# EasyEDA Pro project New Project_2026-05-11_10-13-02.eprj

# Schematic test1_bruk
Board Name: Board1; Create Date: 2026-05-11; Page Name: schematic_1; Project Name: New Project_2026-05-11_10-13-02; Schematic Name: test1_bruk; Update Date: 2026-05-28; Company: EasyEDA.com; Page Size: A4; Version: V1.0
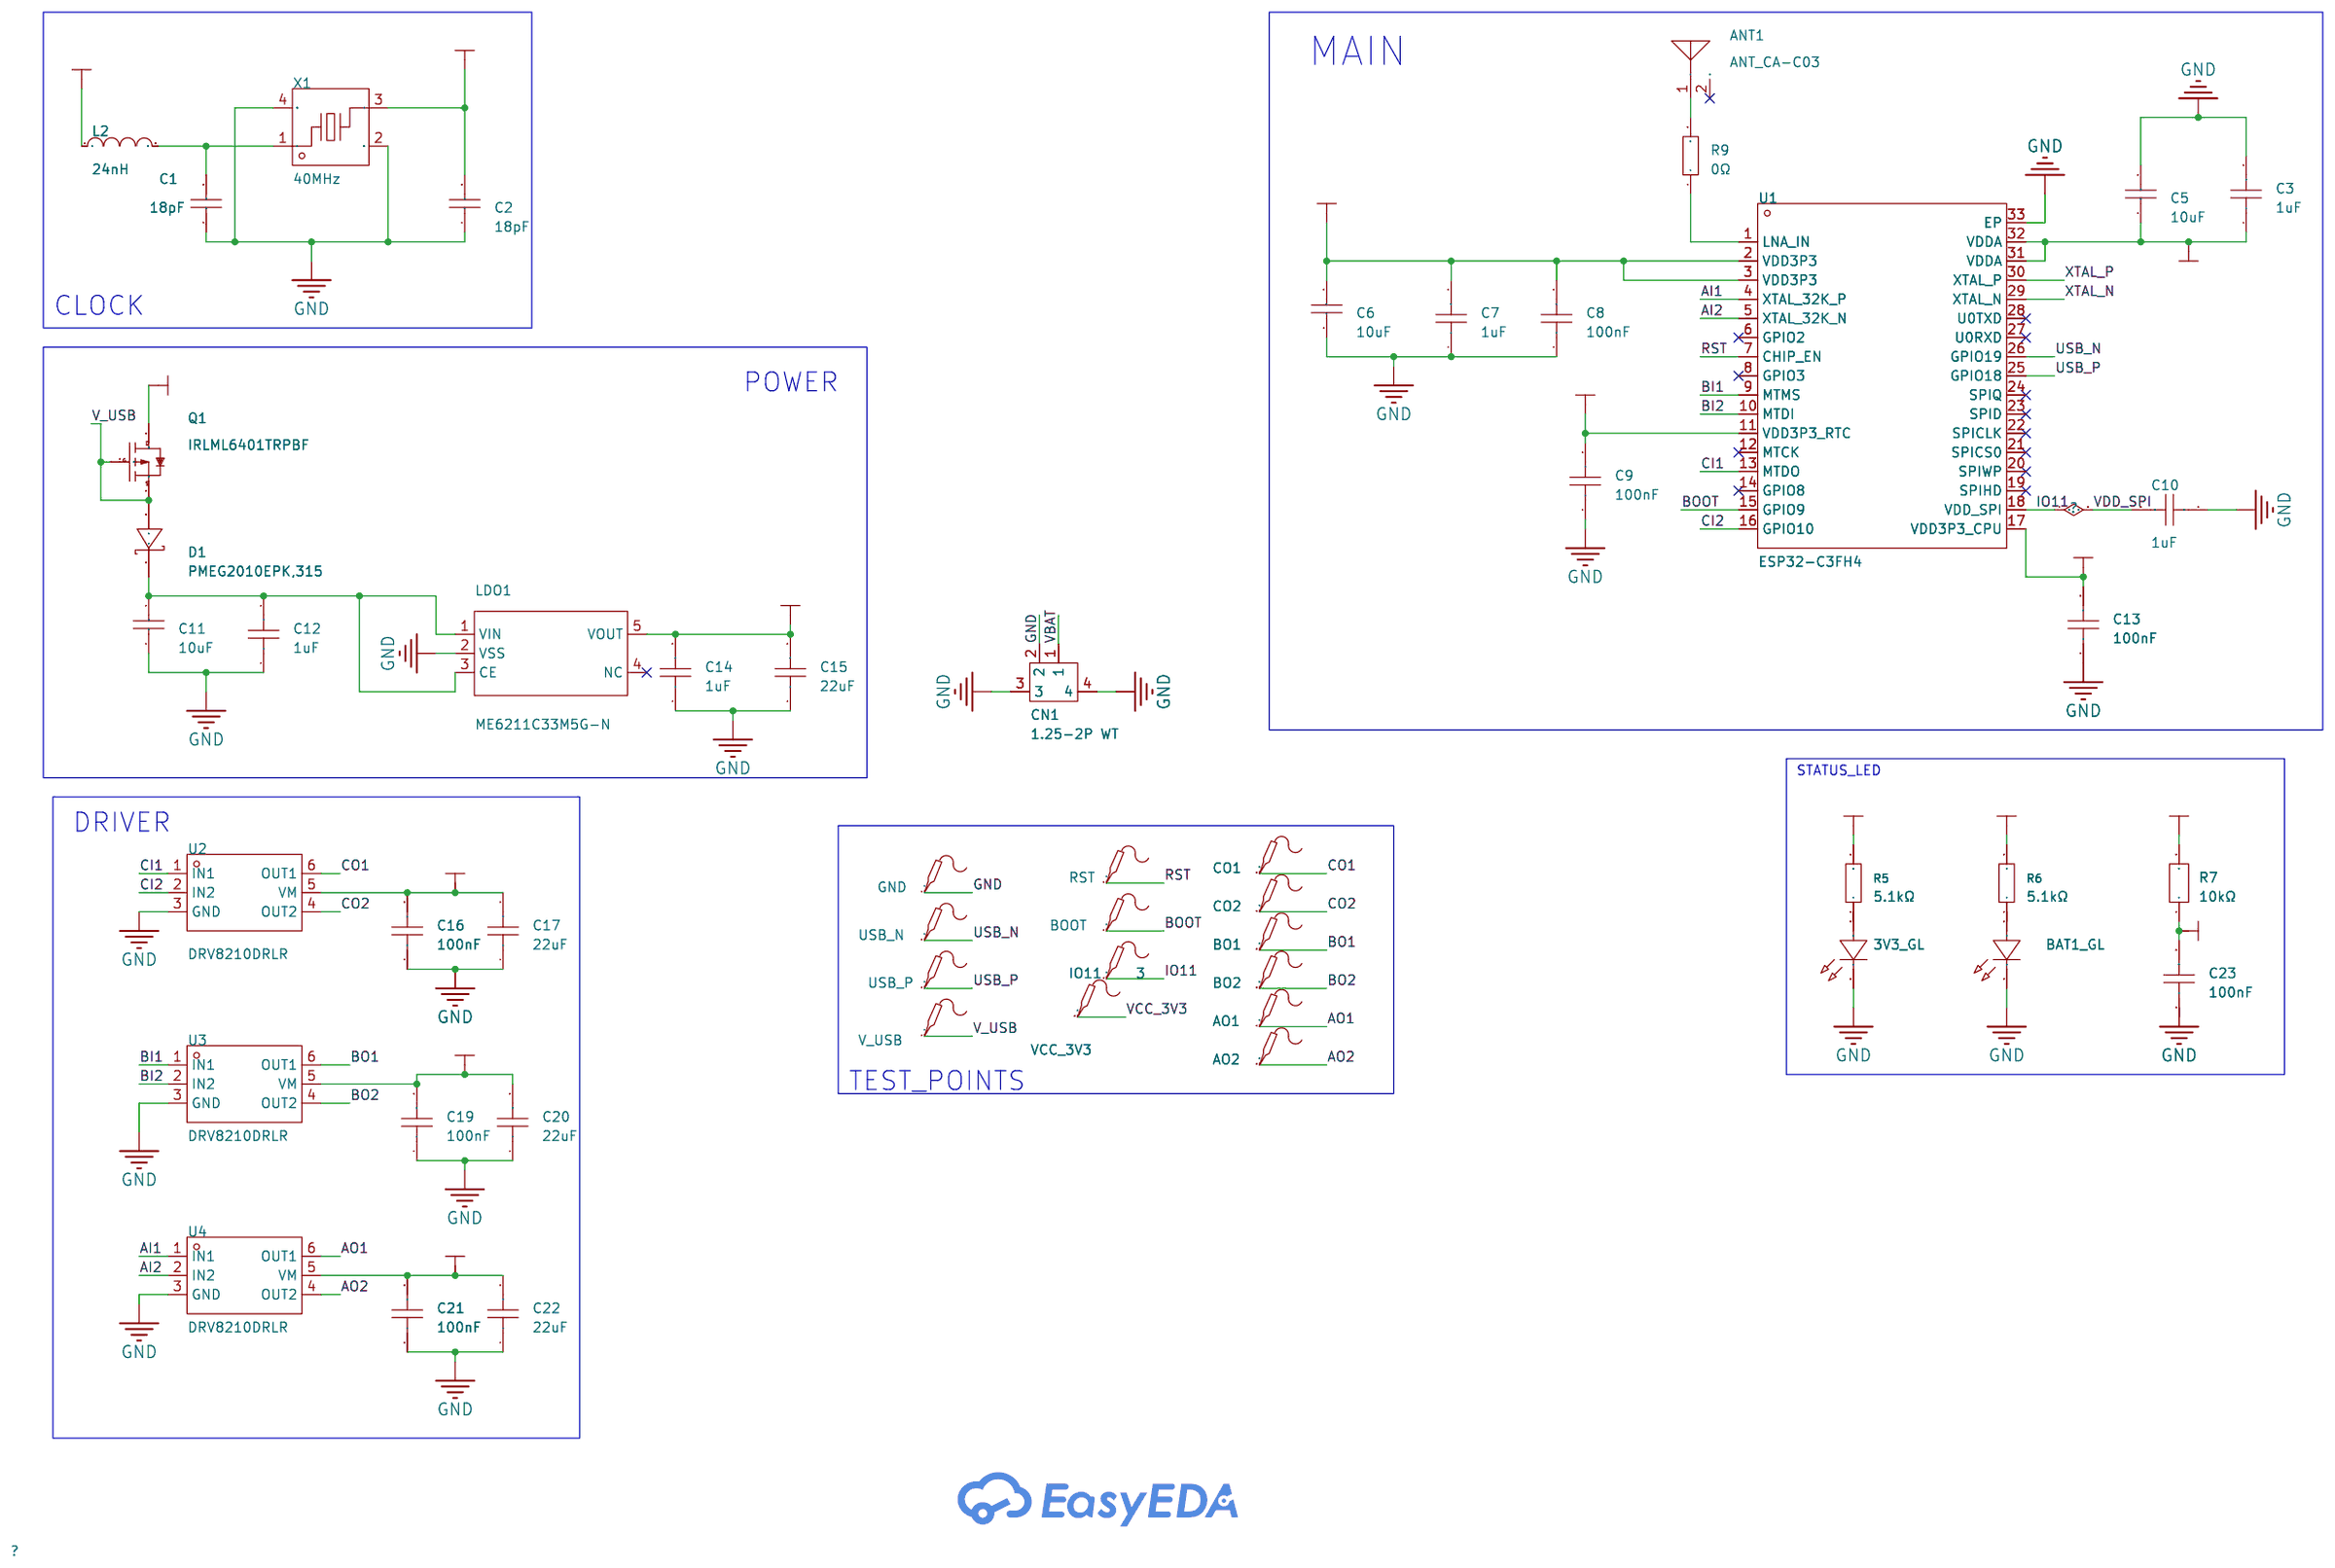
[diagram p0: schematic sheet]

## Parts
3V3_GL  YLED0402G  [LED0402-R-RD]
ANT1  ANT_CA-C03  [ANT-SMD_L5.5-W2.0]
AO1  -  [Test-Point-0.5mm]
AO2  -  [Test-Point-0.5mm]
BAT1_GL  YLED0402G  [LED0402-R-RD]
BO1  -  [Test-Point-0.5mm]
BO2  -  [Test-Point-0.5mm]
BOOT  -  [Test-Point-0.5mm]
C1  18pF  [C0402]
C2  18pF  [C0402]
C3  1uF  [C0201]
C5  10uF  [C0402]
C6  10uF  [C0402]
C7  1uF  [C0201]
C8  100nF  [C0402]
C9  100nF  [C0402]
C10  1uF  [C0201]
C11  10uF  [C0402]
C12  1uF  [C0201]
C13  100nF  [C0402]
C14  1uF  [C0201]
C15  22uF  [C0402]
C16  100nF  [C0402]
C17  22uF  [C0402]
C19  100nF  [C0402]
C20  22uF  [C0402]
C21  100nF  [C0402]
C22  22uF  [C0402]
C23  100nF  [C0402]
CN1  1.25-2P WT  [CONN-SMD_1.25-2PWT]
CO1  -  [Test-Point-0.5mm]
CO2  -  [Test-Point-0.5mm]
D1  PMEG2010EPK,315  [SOD1608_L1.6-W0.8-LS1.6-RD]
GND  -  [Test-Point-0.5mm]
IO11  -  [Test-Point-0.5mm]
L2  24nH  [L0402-RD]
LDO1  ME6211C33M5G-N  [SOT-23-5_L3.0-W1.7-P0.95-LS2.8-BL]
Q1  IRLML6401TRPBF  [SOT-23-3_L2.9-W1.3-P1.90-LS2.4-BR]
R5  5.1kΩ  [R0402]
R6  5.1kΩ  [R0402]
R7  10kΩ  [R0402]
R9  0Ω  [R0402]
RST  -  [Test-Point-0.5mm]
U1  ESP32-C3FH4  [QFN-32_L5.0-W5.0-P0.50-TL-EP3.7]
U2  DRV8210DRLR  [SOT-563-6_L1.6-W1.2-P0.5-LS1.6-BR]
U3  DRV8210DRLR  [SOT-563-6_L1.6-W1.2-P0.5-LS1.6-BR]
U4  DRV8210DRLR  [SOT-563-6_L1.6-W1.2-P0.5-LS1.6-BR]
USB_N  -  [Test-Point-0.5mm]
USB_P  -  [Test-Point-0.5mm]
V_USB  -  [Test-Point-0.5mm]
VCC_3V3  3  [Test-Point-0.5mm]
X1  40MHz  [CRYSTAL-SMD_4P-L2.0-W1.6-BL-2]

## Library data of the parts
3V3_GL BAT1_GL = YLED0402G: LCSC Part Name: 发光管; Supplier Part: C20608784; Manufacturer: YONGYUTAI(永裕泰); Supplier Footprint: 0402; JLCPCB Part Class: Extended Part; Datasheet: https://item.szlcsc.com/datasheet/YLED0402G/21958291.html; Supplier: LCSC; Illumination Color: Emerald Green; Voltage - Forward(Vf): 2.4V~3.1V; Power(Watts): 100mW; Forward Current: 20mA; Wavelength - Dominant: 513nm~534nm; Peak Wavelength: 525nm; Diode Configuration: Discrete Diode; Lens Color: Water Clear; Luminous Intensity: 520mcd; Viewing Angle: 120°; Operating Temperature: -40℃~+85℃
ANT1 = ANT_CA-C03: Supplier Part: C9900003739; Supplier Footprint: ANT-SMD_L5.5-W2.0-P5.0; JLCPCB Part Class: Extended Part; Supplier: LCSC
AO1 AO2 BO1 BO2 BOOT CO1 CO2 GND IO11 RST USB_N USB_P V_USB VCC_3V3 = Test-Point
C1 C2 = 0402CG180J500NT: LCSC Part Name: 18pF ±5% 50V; Supplier Part: C1549; Manufacturer: FH(风华); Supplier Footprint: 0402; JLCPCB Part Class: Basic Part; Datasheet: https://item.szlcsc.com/datasheet/0402CG180J500NT/1901.html; Supplier: LCSC; Tolerance: ±5%; Voltage Rating: 50V; Temperature Coefficient: C0G
C3 C7 C10 C12 C14 = JDK063BJ105MP-FD: Supplier Part: C385990; Manufacturer: TAIYO YUDEN(太诱); Supplier Footprint: 0201; JLCPCB Part Class: Extended Part; Supplier: LCSC; Temperature Coefficient: X5R
C5 C6 C11 = CL05A106MQ5NUNC: LCSC Part Name: 10uF ±20% 6.3V; Supplier Part: C15525; Manufacturer: SAMSUNG(三星); Supplier Footprint: 0402; JLCPCB Part Class: Basic Part; Datasheet: https://item.szlcsc.com/datasheet/CL05A106MQ5NUNC/16204.html; Supplier: LCSC; Tolerance: ±20%; Voltage Rating: 6.3V; Temperature Coefficient: X5R
C8 C9 C13 C16 C19 C21 C23 = CL05B104KO5NNNC: LCSC Part Name: 100nF ±10% 16V; Supplier Part: C1525; Manufacturer: SAMSUNG(三星); Supplier Footprint: 0402; JLCPCB Part Class: Basic Part; Datasheet: https://item.szlcsc.com/datasheet/CL05B104KO5NNNC/1877.html; Supplier: LCSC; Tolerance: ±10%; Voltage Rating: 16V; Temperature Coefficient: X7R
C15 C17 C20 C22 = 04026D226MAT2A: LCSC Part Name: 22uF ±20% 6.3V; Supplier Part: C2179118; Manufacturer: Kyocera AVX; Supplier Footprint: 0402; JLCPCB Part Class: Extended Part; Supplier: LCSC; Tolerance: ±20%; Voltage Rating: 6.3V; Temperature Coefficient: X5R
CN1 = 1.25-2P WT: LCSC Part Name: 1x2P 间距:1.25mm 卧贴 系列:PicoBlade(MX 1.25); Supplier Part: C668614; Manufacturer: SHOU HAN(首韩); Supplier Footprint: SMD,P=1.25mm,卧贴; JLCPCB Part Class: Extended Part; Datasheet: https://atta.szlcsc.com/upload/public/pdf/source/20200618/C668614_A66416DD0743C4A51377B45DB73E146E.pdf; Supplier: LCSC; Pins Structure: 1x2P; Pitch: 1.25mm; Mounting Type: Horizontal attachment; Reference Series: PicoBlade(MX 1.25); Number of Pins: 2P; Number of Rows: 1; Number of PINs Per Row: 2; Current Rating: 1A; Contact Material: Brass; Contact Plating: Tin; Operating Temperature: -25℃~+85℃; Voltage Rating: 125V; Plastic Material: LCP; Flame Retardant Rating: UL94V-0; Color: Beige
D1 = PMEG2010EPK,315: LCSC Part Name: 电压:20V 电流:1A; Supplier Part: C552829; Manufacturer: Nexperia(安世); Supplier Footprint: DFN1608-2; JLCPCB Part Class: Extended Part; Datasheet: https://item.szlcsc.com/datasheet/PMEG2010EPK%252C315/573826.html; Supplier: LCSC; Voltage - Forward(Vf@If): 415mV@1A; Voltage - DC Reverse(Vr): 20V; Current - Rectified: 1A; Reverse Leakage Current (Ir): 600uA@20V; Non-Repetitive Peak Forward Surge Current: 5A
L2 = SDCL1005C24NJTDF: LCSC Part Name: 24nH ±5%; Supplier Part: C74301; Manufacturer: Sunlord(顺络); Supplier Footprint: 0402; JLCPCB Part Class: Extended Part; Datasheet: https://atta.szlcsc.com/upload/public/pdf/source/20231027/6126A3AAC5912C34388756BE22DEE00C.pdf; Supplier: LCSC; Tolerance: ±5%
LDO1 = ME6211C33M5G-N: LCSC Part Name: 输入6V 输出3.3V 500mA; Supplier Part: C82942; Manufacturer: MICRONE(南京微盟); Supplier Footprint: SOT-23-5; JLCPCB Part Class: Extended Part; Datasheet: https://item.szlcsc.com/datasheet/ME6211C33M5G-N/84106.html; Supplier: LCSC; Output Type: Fixed; Voltage - Supply: 6V; Output Voltage: 3.3V; Output Current: 500mA; Power Supply Rejection Ratio (PSRR): 70dB@(1kHz); Voltage Dropout: 120mV@(100mA); standby current: 60uA; Noise: 50uVrms; Features: Over Current Protection；Enable；Short Circuit Protection; Operating Temperature: -40℃~+150℃; Output Configuration: Positive; Number of Outputs: 1
Q1 = IRLML6401TRPBF_C5182042: LCSC Part Name: -12V P沟道MOSFET; Supplier Part: C5182042; Manufacturer: TECH PUBLIC(台舟); Supplier Footprint: SOT-23; JLCPCB Part Class: Extended Part; Datasheet: https://item.szlcsc.com/datasheet/IRLML6401TRPBF/5842182.html; Supplier: LCSC; Drain to Source Voltage: 12V; Current - Continuous Drain(Id): 4.3A; RDS(on): 50mΩ@4.5V; Input Capacitance(Ciss): 830pF; Operating Temperature: -55℃~+150℃; Output Capacitance(Coss): 180pF
R5 R6 = 0402WGF5101TCE: LCSC Part Name: 5.1kΩ ±1% 62.5mW 厚膜电阻; Supplier Part: C25905; Manufacturer: UNI-ROYAL(厚声); Supplier Footprint: 0402; JLCPCB Part Class: Basic Part; Datasheet: https://item.szlcsc.com/datasheet/0402WGF5101TCE/26648.html; Supplier: LCSC; Type: Thick Film Resistor; Tolerance: ±1%; Power(Watts): 62.5mW; Voltage-Supply(Max): 50V; Temperature Coefficient: ±100ppm/℃; Operating Temperature: -55℃~+155℃
R7 = SCR0402F10K: LCSC Part Name: 厚膜电阻 10kΩ ±1% 62.5mW; Supplier Part: C3015825; Manufacturer: VO(翔胜); Supplier Footprint: 0402; JLCPCB Part Class: Extended Part; Datasheet: https://item.szlcsc.com/datasheet/SCR0402F10K/3528279.html; Supplier: LCSC; Type: Thick Film Resistor; Tolerance: ±1%; Power(Watts): 62.5mW; Voltage-Supply(Max): 50V; Operating Temperature: -55℃~+155℃
R9 = RC0402FR-070RL: LCSC Part Name: 厚膜电阻 0Ω ±1% 62.5mW; Supplier Part: C106231; Manufacturer: YAGEO(国巨); Supplier Footprint: 0402; JLCPCB Part Class: Extended Part; Datasheet: https://item.szlcsc.com/datasheet/RC0402FR-070RL/107446.html; Supplier: LCSC; Type: Thick Film Resistors; Tolerance: ±1%; Power(Watts): 62.5mW; Voltage-Supply(Max): 50V; Operating Temperature: -55℃~+155℃
U1 = ESP32-C3FH4: LCSC Part Name: 不带固件 ESP32-C3 是一款低功耗、高集成度的 MCU 系统级芯片 (SoC)，集成 2.4 GHz Wi-Fi 和低功耗蓝牙 (Bluetooth® LE) 无线通信。; Supplier Part: C2858491; Manufacturer: ESPRESSIF(乐鑫); Supplier Footprint: QFN-32-EP(5x5); JLCPCB Part Class: Extended Part; Datasheet: https://item.szlcsc.com/datasheet/ESP32-C3FH4/3060870.html; Supplier: LCSC
U2-U4 = DRV8210DRLR: LCSC Part Name: 1.76A 有刷直流电机驱动芯片 11V; Supplier Part: C3681297; Manufacturer: TI(德州仪器); Supplier Footprint: SOT-563; JLCPCB Part Class: Extended Part; Datasheet: https://www.ti.com/cn/lit/gpn/drv8210; Supplier: LCSC; Voltage - Supply: 1.65V~11V; Peak Current: 1.76A; RDS(on): 950mΩ; Operating Temperature: -40℃~+125℃; Input Logic Level - High: 1.45V~5.5V; Input Logic Level - Low: 0V~400mV
X1 = T201640MFBDE2X: LCSC Part Name: 40MHz ±10ppm 12pF; Supplier Part: C20885029; Manufacturer: YJX(雅晶鑫); Supplier Footprint: SMD2016-4P; JLCPCB Part Class: Extended Part; Datasheet: https://item.szlcsc.com/datasheet/T201640MFBDE2X/22301409.html; Supplier: LCSC; Type: Crystal Oscillator; Normal temperature Frequency Tolerance: ±10ppm; Load Capacitance: 12pF; Frequency Stability: ±30ppm; Equivalent Series Resistance(ESR): 40Ω; Operating Temperature: -30℃~+85℃

## Nets
GND: 3V3_GL.2(K) BAT1_GL.2(K) C1.1 C2.1 C3.2 C5.2 C6.1 C7.1 C8.1 C9.1 C10.1 C11.1 C12.1 C13.1 C14.1 C15.1 C16.1 C17.1 C19.1 C20.1 C21.1 C22.1 C23.1 CN1.2 CN1.3 CN1.4 GND.1 LDO1.2(VSS) U1.33(EP) U2.3(GND) U3.3(GND) U4.3(GND) X1.2(GND) X1.4(GND)
VBAT: C16.2 C17.2 C19.2 C20.2 C21.2 C22.2 CN1.1 Q1.3(D) R6.2 U2.5(VM) U3.5(VM) U4.5(VM)
VCC_3V3: C3.1 C5.1 C6.2 C7.2 C8.2 C9.2 C13.2 C14.2 C15.2 LDO1.5(VOUT) R5.2 R7.2 U1.2(VDD3P3) U1.3(VDD3P3) U1.11(VDD3P3_RTC) U1.17(VDD3P3_CPU) U1.31(VDDA) U1.32(VDDA) VCC_3V3.1
AI1: U1.4(XTAL_32K_P) U4.1(IN1)
AI2: U1.5(XTAL_32K_N) U4.2(IN2)
AO1: AO1.1 U4.6(OUT1)
AO2: AO2.1 U4.4(OUT2)
BI1: U1.9(MTMS) U3.1(IN1)
BI2: U1.10(MTDI) U3.2(IN2)
BO1: BO1.1 U3.6(OUT1)
BO2: BO2.1 U3.4(OUT2)
BOOT: BOOT.1 U1.15(GPIO9)
CI1: U1.13(MTDO) U2.1(IN1)
CI2: U1.16(GPIO10) U2.2(IN2)
CO1: CO1.1 U2.6(OUT1)
CO2: CO2.1 U2.4(OUT2)
IO11: C10.2 IO11.1 U1.18(VDD_SPI)
RST: C23.2 R7.1 RST.1 U1.7(CHIP_EN)
USB_N: U1.26(GPIO19) USB_N.1
USB_P: U1.25(GPIO18) USB_P.1
V_USB: D1.2(A) Q1.1(G) Q1.2(S) V_USB.1
XTAL_N: C2.2 U1.29(XTAL_N) X1.3
XTAL_P: L2.1 U1.30(XTAL_P)
$1N1152: 3V3_GL.1(A) R5.1
$1N1322: BAT1_GL.1(A) R6.1
$1N1948: C11.2 C12.2 D1.1(K) LDO1.1(VIN) LDO1.3(CE)
$1N2946: ANT1.1 R9.2
$1N2950: R9.1 U1.1(LNA_IN)
$1N8814: C1.2 L2.2 X1.1

Not connected (* = marked no-connect by the designer): ANT1 2(NC)*; LDO1 4(NC)*; U1 6(GPIO2)* 8(GPIO3)* 12(MTCK)* 14(GPIO8)* 19(SPIHD)* 20(SPIWP)* 21(SPICS0)* 22(SPICLK)* 23(SPID)* 24(SPIQ)* 27(U0RXD)* 28(U0TXD)*

## Notes on the sheet
- MAIN
- CLOCK
- POWER
- STATUS_LED
- DRIVER
- TEST_POINTS

# Board PCB1
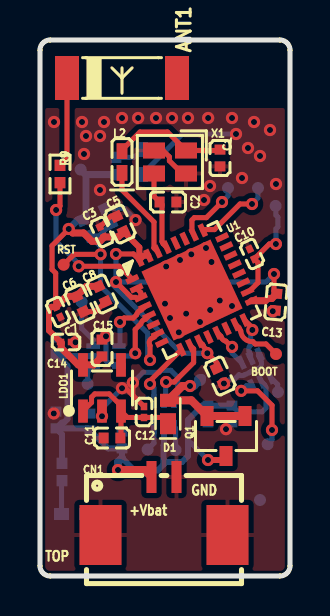
[diagram p1: board, top side]
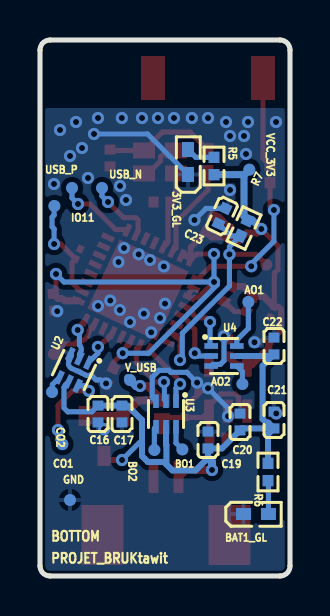
[diagram p2: board, bottom side, seen from below]

Outline 12.5 x 26.8 mm; copper layers: Top Layer, Bottom Layer. Coordinates in mm from the lower left corner of the outline.
Outline path: 0,26.3 0,0.5 arc(0.15,0.15) 0.5,0 12,0 arc(12.35,0.15) 12.5,0.5 12.5,26.3 arc(12.35,26.65) 12,26.8 0.5,26.8 arc(0.15,26.65) 0,26.3
Stack: Top Layer 0.035mm / Dielectric1 1.51mm FR4 er 4.5 / Bottom Layer 0.035mm

## Design rules (mm)
template: Custom Config
spacing copperThickness1oz (default): track to track 0.102, other pairs 0.152 to 0.3
spacing copperThickness2oz: track to track 0.203, other pairs 0.152 to 0.3
spacing copperThicknessInner0.5oz: track to track 0.089, other pairs 0.152 to 0.3
track width copperThickness1oz (default): min 0.127, default 0.254, max 2.54
track width copperThickness2oz: min 0.203, default 0.254, max 2.54
track width copperThickness0.5oz: min 0.089, default 0.254, max 2.54
differential pair differentialPair (default): width min 0.127, default 0.254, max 2.54; gap min 0.152, default 0.152
via viaSize (default): diameter min 0.3, default 0.61, max 10; hole min 0.2, default 0.305, max 6.3

## Placement (name value [footprint] x y rotation side)
3V3_GL  YLED0402G  [LED0402-R-RD]  5.1 20.7 90 bottom
ANT1  ANT_CA-C03  [ANT-SMD_L5.5-W2.0]  4.1 24.9 0 top
AO1  -  [Test-Point-0.5mm]  2.08 13.7 180 bottom
AO2  -  [Test-Point-0.5mm]  2.38 9.6 180 bottom
BAT1_GL  YLED0402G  [LED0402-R-RD]  1.7 3.1 180 bottom
BO1  -  [Test-Point-0.5mm]  5.38 6.33 180 bottom
BO2  -  [Test-Point-0.5mm]  6.78 6.3 180 bottom
BOOT  -  [Test-Point-0.5mm]  11.8 11.1 0 top
C1  18pF  [C0402]  9 20.9 90 top
C2  18pF  [C0402]  6.4 18.7 180 top
C3  1uF  [C0201]  3.1 17.2 115 top
C5  10uF  [C0402]  4 17.6 115 top
C6  10uF  [C0402]  2 13.6 115 top
C7  1uF  [C0201]  0.9 13.2 115 top
C8  100nF  [C0402]  3.1 14.1 115 top
C9  100nF  [C0402]  9 10 115 top
C10  1uF  [C0201]  10.6 16.1 295 top
C11  10uF  [C0402]  3.6 6.9 0 top
C12  1uF  [C0201]  5.2 8.2 270 top
C13  100nF  [C0402]  11.8 13.7 85 top
C14  1uF  [C0201]  1.3 11.7 180 top
C15  22uF  [C0402]  3.1 11.4 270 top
C16  100nF  [C0402]  9.6 8.1 90 bottom
C17  22uF  [C0402]  8.4 8.1 90 bottom
C19  100nF  [C0402]  4.1 6.8 270 bottom
C20  22uF  [C0402]  2.5 7.7 270 bottom
C21  100nF  [C0402]  0.8 7.8 270 bottom
C22  22uF  [C0402]  0.8 11.5 270 bottom
C23  100nF  [C0402]  3.4 18 295 bottom
CN1  1.25-2P WT  [CONN-SMD_1.25-2PWT]  6.2 3.5 180 top
CO1  -  [Test-Point-0.5mm]  11.38 6.59 180 bottom
CO2  -  [Test-Point-0.5mm]  11.9 9.2 180 bottom
D1  PMEG2010EPK,315  [SOD1608_L1.6-W0.8-LS1.6-RD]  6.4 8.2 90 top
GND  -  [Test-Point-0.5mm]  11 3.8 180 bottom
IO11  -  [Test-Point-0.5mm]  11.78 18.5 180 bottom
L2  24nH  [L0402-RD]  4.1 20.7 90 top
LDO1  ME6211C33M5G-N  [SOT-23-5_L3.0-W1.7-P0.95-LS2.8-BL]  3.1 9.4 0 top
Q1  IRLML6401TRPBF  [SOT-23-3_L2.9-W1.3-P1.90-LS2.4-BR]  9.3 7 90 top
R5  5.1kΩ  [R0402]  3.8 20.5 270 bottom
R6  5.1kΩ  [R0402]  1.1 5.2 90 bottom
R7  10kΩ  [R0402]  2.3 17.4 115 bottom
R9  0Ω  [R0402]  1 20.1 90 top
RST  -  [Test-Point-0.5mm]  1.18 15.56 90 top
U1  ESP32-C3FH4  [QFN-32_L5.0-W5.0-P0.50-TL-EP3.7]  7.6 14.3 25 top
U2  DRV8210DRLR  [SOT-563-6_L1.6-W1.2-P0.5-LS1.6-BR]  10.8 10.3 115 bottom
U3  DRV8210DRLR  [SOT-563-6_L1.6-W1.2-P0.5-LS1.6-BR]  6.2 8.1 90 bottom
U4  DRV8210DRLR  [SOT-563-6_L1.6-W1.2-P0.5-LS1.6-BR]  3.3 11 0 bottom
USB_N  -  [Test-Point-0.5mm]  9.4 19.4 180 bottom
USB_P  -  [Test-Point-0.5mm#2]  10.9 19.4 180 bottom
V_USB  -  [Test-Point-0.5mm]  8 9.8 180 bottom
VCC_3V3  3  [Test-Point-0.5mm]  2.03 20.32 90 bottom
X1  40MHz  [CRYSTAL-SMD_4P-L2.0-W1.6-BL-2]  6.5 20.7 180 top

## Footprints (pads in the part's own frame, mm; a bottom-side part is the same pattern mirrored in y, then rotated)
ANT-SMD_L5.5-W2.0
  rect 1.2x2.2 smd: 1(-2.75,0) 2(2.75,0)
C0201
  rect 0.368x0.324 smd: 1(-0.275,0) 2(0.275,0)
C0402
  rect 0.5x0.54 smd: 1(-0.42,0) 2(0.42,0)
CONN-SMD_1.25-2PWT
  rect 0.5x1.6 smd: 1(0.625,-1.45) 2(-0.625,-1.45)
  rect 2.1x3 smd: 3(3.175,1.45) 4(-3.175,1.45)
CRYSTAL-SMD_4P-L2.0-W1.6-BL-2
  rect 1.1x0.8 smd: 1(-0.8,-0.575) 2(0.8,-0.575) 3(0.8,0.575) 4(-0.8,0.575)
L0402-RD
  rect 0.79x0.54 smd: 1(-0.545,0) 2(0.545,0)
LED0402-R-RD
  rect 0.75x0.6 smd: 1(0.623,0) 2(-0.623,0)
QFN-32_L5.0-W5.0-P0.50-TL-EP3.7
  rect 0.65x0.28 smd: 1(-2.478,1.75) 2(-2.478,1.25) 3(-2.478,0.75) 4(-2.478,0.25) 5(-2.478,-0.25) 6(-2.478,-0.75) 7(-2.478,-1.25) 8(-2.478,-1.75) 17(2.478,-1.75) 18(2.478,-1.25) 19(2.478,-0.75) 20(2.478,-0.25) 21(2.478,0.25) 22(2.478,0.75) 23(2.478,1.25) 24(2.478,1.75)
  rect 0.28x0.65 smd: 9(-1.75,-2.478) 10(-1.25,-2.478) 11(-0.75,-2.478) 12(-0.25,-2.478) 13(0.25,-2.478) 14(0.75,-2.478) 15(1.25,-2.478) 16(1.75,-2.478) 25(1.75,2.478) 26(1.25,2.478) 27(0.75,2.478) 28(0.25,2.478) 29(-0.25,2.478) 30(-0.75,2.478) 31(-1.25,2.478) 32(-1.75,2.478)
  rect 3.8x3.8 smd: 33(0,0)
R0402
  rect 0.566x0.54 smd: 1(-0.433,0) 2(0.433,0)
SOD1608_L1.6-W0.8-LS1.6-RD
  rect 1.049x0.8 smd: 1(-0.584,0)
  rect 0.65x0.8 smd: 2(0.584,0)
SOT-23-3_L2.9-W1.3-P1.90-LS2.4-BR
  rect 1x0.65 smd: 1(1,-0.95) 2(1,0.95) 3(-1,0)
SOT-23-5_L3.0-W1.7-P0.95-LS2.8-BL
  rect 0.49x1.157 smd: 1(-0.95,-1.153) 2(0,-1.153) 3(0.95,-1.153)
  rect 0.49x1.175 smd: 4(0.95,1.153) 5(-0.95,1.153)
SOT-563-6_L1.6-W1.2-P0.5-LS1.6-BR
  rect 0.68x0.28 smd: 1(0.64,-0.5) 2(0.64,0) 3(0.64,0.5) 4(-0.64,0.5) 5(-0.64,0) 6(-0.64,-0.5)
Test-Point-0.5mm
  oval 0.6x0.6 smd: 1(0,0)
Test-Point-0.5mm#2
  round 0.6 smd: 1(0,0)

## Nets
As in the schematic.

Pads without a net: ANT1 2; LDO1 4; U1 6 8 12 14 19 20 21 22 23 24 27 28

## Via types
v1: diameter 0.61, hole 0.305, Top Layer to Bottom Layer, 69 vias

## Routing (per net, layer and track width the routed paths; a pad name or vN(x,y) marks a point on that pad's centre or on a via; arc(x,y) is an arc through that point)
GND: length 24.2
  Top Layer w0.254: C3.2 3,17.45 3.53,17.98 C5.2 ; v1(4.65,9.67) 4.65,9.04 4.64,9.04 ; 4.64,9.04 4.28,9.39 v1(4.1,9.39) ; 4.64,9.04 C12.1 ; C8.1 2.78,13.22 C6.1 ; C9.1 9.19,9.63 v1(9.2,9.63) ; X1.4 7.11,20.12 6.47,20.76 6.47,20.95 6.15,21.27 X1.2
  Bottom Layer w0.254: U4.3 3.86,10.58 3.48,10.58 3.3,10.77 v1(3.3,11.99) ; v1(9.8,22.1) 7.12,22.1 3V3_GL.2 ; v1(4.1,9.39) 3.1,8.39 v1(3.1,7.99) ; C23.1 4.19,18.38 v1(4.78,17.8) ; U3.3 6.89,8.93 6.89,9.94 6.54,10.28 6.06,10.28 5.96,10.18 5.16,10.18 v1(4.65,9.67) ; 9.46,9.81 9.7,9.81 9.95,10.06 arc(10.08,10.02) 10.21,10.05 10.47,10.17 arc(10.51,10.2) 10.56,10.23 arc(10.61,10.24) 10.66,10.26 10.92,10.38 arc(11.06,10.54) 11.05,10.75 10.92,11.03 U2.3
  vias: v1(0.7,22.7) v1(0.69,8.13) v1(1.78,11.69) v1(2.1,22.7) v1(2.2,21.1) v1(2.3,22) v1(3,22) v1(3,19.3) v1(3.2,22.7) v1(4.1,22.9) v1(4.91,22.9) v1(5.8,22.9) v1(6.25,13.62) v1(6.31,15.47) v1(6.5,12.9) v1(6.6,22.9) v1(6.94,12.18) v1(7,15.8) v1(7.31,13.12) v1(7.4,22.9) v1(7.57,16.08) v1(8,12.7) v1(8.2,18.8) v1(8.3,16.4) v1(8.41,22.9) v1(8.5,19.5) v1(8.51,13.3) v1(8.57,15.7) v1(8.99,13.77) v1(9.3,7.34) v1(9.6,22.9) v1(9.6,13.5) v1(10.1,19.9) v1(10.4,21.4) v1(10.7,22.7) v1(11,21) v1(11.5,22.3) v1(11.64,13.24) v1(11.8,19.6)
VBAT: length 30.3
  Top Layer w0.3: Q1.3 9.1,5.8 v1(8.4,5.8)
  Top Layer w0.4: v1(3.9,5.3) 5.22,5.3 CN1.1
  Bottom Layer w0.254: C16.2 9.91,8.21 11.11,8.21 11.3,8.4 11.3,9.42 arc(11.29,9.43) 11.29,9.45 11.24,9.55 U2.5 ; v1(8.4,5.8) 7.55,6.65 7.4,6.65
  Bottom Layer w0.3: 6.18,5.58 6.3,5.7 7.1,5.7 7.4,6 7.4,7.8 8.12,8.52 C17.2 C16.2 ; 6.18,5.58 6.18,6.55 6.2,6.57 U3.5 ; 6.18,5.58 5.88,5.28 4.72,5.28 4.1,5.9 C19.2 3.4,6.38 C20.2 2.4,7.38 C21.2 ; U4.5 0.88,11 ; 0.88,11 C22.2 ; 0.88,11 1.37,10.51 1.37,7.84 1.19,7.67 1.09,7.67 C21.2 ; C21.2 1.1,7.08 1.1,5.63
  Bottom Layer w0.4: 4.1,5.9 3.9,5.7 v1(3.9,5.3)
VCC_3V3: length 45.7
  Top Layer w0.254: C9.2 8.82,10.68 v1(8.37,11.14) 8.37,11.32 arc(8.25,11.38) 8.18,11.48 8.13,11.57 U1.11 ; C7.2 0.78,15.14 0.6,15.33 0.6,16.52 v1(1.44,17.35) ; v1(3.8,16.1) 4.67,16.1 4.97,15.81 ; v1(3.8,14.7) 4.57,13.93 4.8,13.93 ; v1(11.7,15.1) 11.7,14.25 C13.2 ; U1.3 5.04,14.17 U1.2
  Top Layer w0.3: C5.1 4.97,16.43 4.97,15.81 5.18,16.02 5.42,16.02 ; C14.2 0.45,12.28 0.45,13.34 0.57,13.46 0.77,13.46
  Top Layer w0.35: 3.19,16.95 C3.1 3.91,16.95 C5.1 ; 3.19,16.92 3,16.73 2.6,16.73 2.18,17.15 1.64,17.15 v1(1.44,17.35) ; C13.2 11.59,13.88 11.54,13.88 arc(11.39,13.86) 11.26,13.76 U1.17 ; C14.2 1.06,11.66 1.06,11.4 1.91,10.55 LDO1.5 2.67,10.55 C15.2 ; C8.2 2.32,14.48 C6.2 1.32,13.98 C7.2
  Bottom Layer w0.254: v1(8.37,11.14) 7.06,11.14 3.65,14.55 v1(3.8,14.7) ; v1(11.7,15.1) 11.3,14.7 v1(3.8,14.7) ; v1(3.8,14.7) v1(3.8,16.1)
  Bottom Layer w0.35: 2.28,20.07 2.3,20.05 2.3,17.97 2.12,17.79 1.88,17.79 v1(1.44,17.35) ; 2.28,20.07 VCC_3V3.1 ; 2.28,20.07 R5.2
AI1: length 2.8
  Top Layer w0.254: v1(4,12.7) 4.2,12.9 4.67,12.9 4.83,13.06 arc(4.88,13.18) 4.99,13.27 5.08,13.31 U1.4
  Bottom Layer w0.254: U4.1 4,11.56 v1(4,12.7)
AI2: length 3.1
  Top Layer w0.254: v1(4.76,11.14) 4.76,12.33 5.04,12.61 ; U1.5 5.29,12.86 5.2,12.82 arc(5.1,12.73) 5.04,12.61
  Bottom Layer w0.254: U4.2 4.62,11 v1(4.76,11.14)
AO1: length 2.4
  Bottom Layer w0.254: U4.6 2.66,11.8 2.08,12.38 AO1.1
AO2: length 1
  Bottom Layer w0.254: U4.4 2.38,10.22 AO2.1
BI1: length 3.3
  Top Layer w0.254: v1(5.5,9.6) 5.5,9.75 U1.9
  Bottom Layer w0.254: v1(5.5,9.6) 5.7,9.4 U3.1
BI2: length 3.7
  Top Layer w0.254: v1(6.3,9.7) 6.71,9.7 7.68,10.67 7.68,11.36 U1.10
  Bottom Layer w0.254: v1(6.3,9.7) 6.28,9.68 6.28,8.82 U3.2
BO1: length 1.3
  Bottom Layer w0.254: U3.6 5.7,6.65 BO1.1
BO2: length 1.2
  Bottom Layer w0.254: U3.4 6.78,7.38 BO2.1
BOOT: length 2.7
  Top Layer w0.254: BOOT.1 11.3,11.6 10.76,11.6 10.64,11.72 arc(10.23,11.86) 10.03,12.26 arc(10.01,12.29) 9.99,12.32 9.95,12.41 9.78,12.58
CI1: length 2
  Top Layer w0.254: v1(9.6,11.45) 9.58,11.45 9.29,11.74 arc(9.17,11.8) 9.08,11.9 9.04,11.99 U1.13
  Bottom Layer w0.254: U2.1 9.6,11.14 v1(9.6,11.45)
CI2: length 2.2
  Top Layer w0.254: v1(10.62,12.3) 10.62,12.41 10.23,12.79
  Bottom Layer w0.254: U2.2 10.53,11.07 10.46,11.22 arc(10.44,11.4) 10.53,11.55 10.53,12.21 v1(10.62,12.3)
CO1: length 4.5
  Top Layer w0.254: v1(10.06,9.26) 10.88,9.26 11.6,8.53 v1(11.6,7.3)
  Bottom Layer w0.254: v1(11.6,7.3) 11.6,6.81 CO1.1 ; U2.6 10.31,9.51 v1(10.06,9.26)
CO2: length 1
  Bottom Layer w0.254: 11.88,9.06 11.88,9.57 U2.4
IO11: length 5.2
  Top Layer w0.254: v1(11.79,16.6) 11.46,16.6 C10.2 10.9,15.67 10.9,14.67 10.54,14.3
  Bottom Layer w0.254: v1(11.79,16.6) 11.79,17.36 11.9,17.46 11.9,17.94 11.79,18.04 11.79,18.49 IO11.1
RST: length 12.4
  Top Layer w0.254: 5.88,12.12 5.72,11.95 5.62,11.91 arc(5.48,11.75) 5.49,11.54 5.5,11.51 v1(5.5,10.8) ; RST.1 1.7,16.08 v1(3.03,16.08)
  Bottom Layer w0.254: C23.2 2.97,17.01 2.48,17.01 3.03,16.46 v1(3.03,16.08) 3.03,14.5 5.38,12.14 5.38,10.92 v1(5.5,10.8)
USB_N: length 3.3
  Top Layer w0.254: 7.6,17.23 7.6,17.8 7.72,17.92 8.32,17.92 v1(9.1,18.7)
  Bottom Layer w0.254: v1(9.1,18.7) 9.4,19 USB_N.1
USB_P: length 3.9
  Top Layer w0.254: v1(10.6,18.6) 10,18.6 8.72,17.32 8.18,17.32
  Bottom Layer w0.254: v1(10.6,18.6) 10.9,18.9 USB_P.1
V_USB: length 6.3
  Top Layer w0.4: v1(7.5,9.5) 7.12,9.5 D1.2 7.57,8.78 Q1.2 Q1.1
  Bottom Layer w0.4: 8.1,9.9 7.7,9.5 v1(7.5,9.5)
XTAL_N: length 3.9
  Top Layer w0.254: X1.3 5.7,18.98 C2.2 6.1,18.58 6.1,16.73 arc(6.11,16.71) 6.12,16.7 6.16,16.61 U1.29
XTAL_P: length 4.7
  Top Layer w0.254: 5.87,16.23 5.71,16.4 5.7,16.41 5.7,17.7 4.1,19.3 L2.1
$1N1152: length 1.5
  Bottom Layer w0.254: 3.8,20.93 4.71,20.93 3V3_GL.1
$1N1322: length 1.7
  Bottom Layer w0.254: BAT1_GL.1 1.08,4.74 R6.1
$1N1948: length 6.9
  Top Layer w0.254: LDO1.3 4.05,6.93 C11.2 ; LDO1.3 4.37,7.93 C12.2 6.09,7.93 D1.1 ; LDO1.3 4.05,8.51 3.46,9.1 2.74,9.1 2.58,8.94 2.58,8.67 LDO1.1
$1N2946: length 4.5
  Top Layer w0.254: R9.2 1.35,20.88 ANT1.1
$1N2950: length 7.8
  Top Layer w0.254: 1,19.67 1,18.49 v1(0.81,18.3) ; v1(1.94,15.49) 3.97,15.49 U1.1
  Bottom Layer w0.254: v1(1.94,15.49) 1.95,15.5 2.04,15.5 0.81,16.73 v1(0.81,18.3)
$1N8814: length 5.7
  Top Layer w0.254: C1.2 8.96,21.27 X1.1 6.38,22.2 5,22.2 4.1,21.3 4.1,21.24

## Copper pours and planes (outline as drawn; the poured copper is in the pictures)
GND on Top Layer: -1.7,23.4 14.2,23.4 14.2,-1.5 -1.7,-1.5
GND on Bottom Layer: -1.7,23.4 14.2,23.4 14.2,-1.5 -1.7,-1.5

## Text on the board
Bottom Silkscreen Layer: PROJET_BRUKtawit | BOTTOM
Top Silkscreen Layer: GND | TOP | +Vbat
